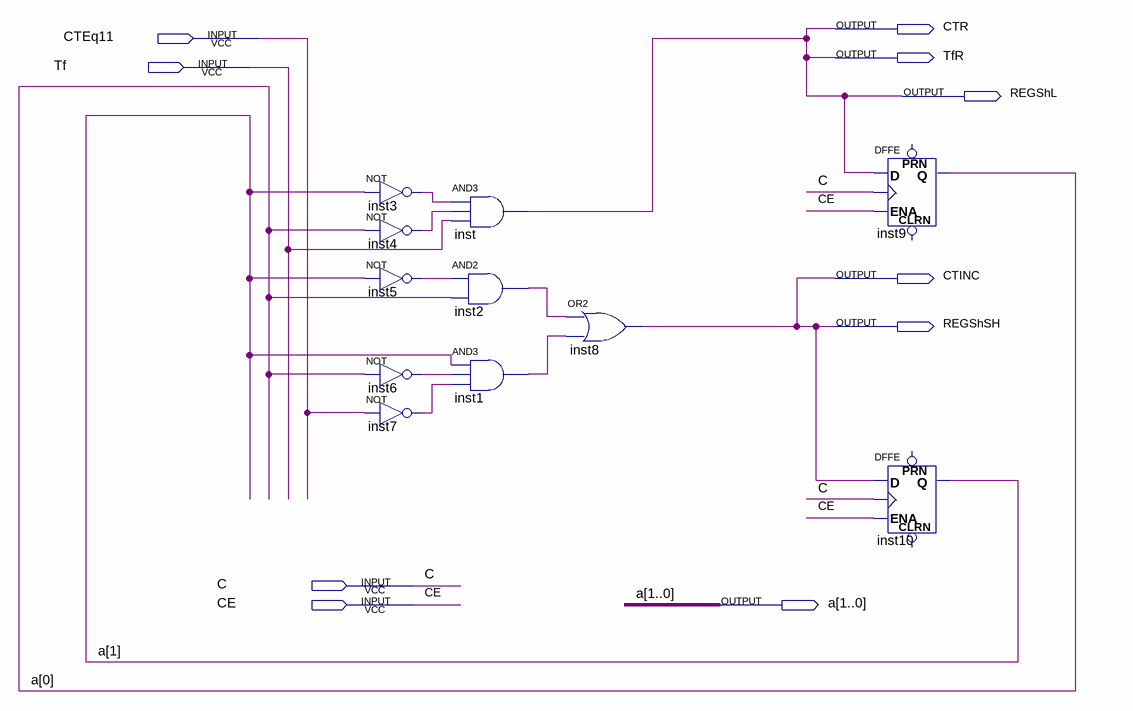
[diagram p0: schematic sheet]
// Quartus schematic CD.bdf as structural Verilog: 11 symbols, 10 pins
module CD (
  input  CTEq11,
  input  Tf,
  input  C,
  input  CE,
  output CTR,
  output TfR,
  output REGShL,
  output CTINC,
  output REGShSH,
  output [1:0] a
);

  wire inst1_out, inst2_out, inst3_out, inst4_out, inst5_out, inst6_out, inst7_out;

  not inst3 (inst3_out, a[1]);
  not inst4 (inst4_out, a[0]);
  not inst5 (inst5_out, a[1]);
  not inst6 (inst6_out, a[0]);
  not inst7 (inst7_out, CTEq11);
  and inst (CTR, inst3_out, inst4_out, Tf);
  and inst2 (inst2_out, inst5_out, a[0]);
  and inst1 (inst1_out, a[1], inst6_out, inst7_out);
  or inst8 (CTINC, inst2_out, inst1_out);
  DFFE inst9 (.D(CTR), .CLK(C), .ENA(CE), .Q(a[0]));  // open: PRN, CLRN
  DFFE inst10 (.D(CTINC), .CLK(C), .ENA(CE), .Q(a[1]));  // open: PRN, CLRN

  assign REGShL = CTR;
  assign REGShSH = CTINC;
  assign TfR = CTR;
endmodule
